# Altium schematic sheet CLOCK_Display.SchDoc
size A4; SheetNumber: 6; SheetTotal: 16
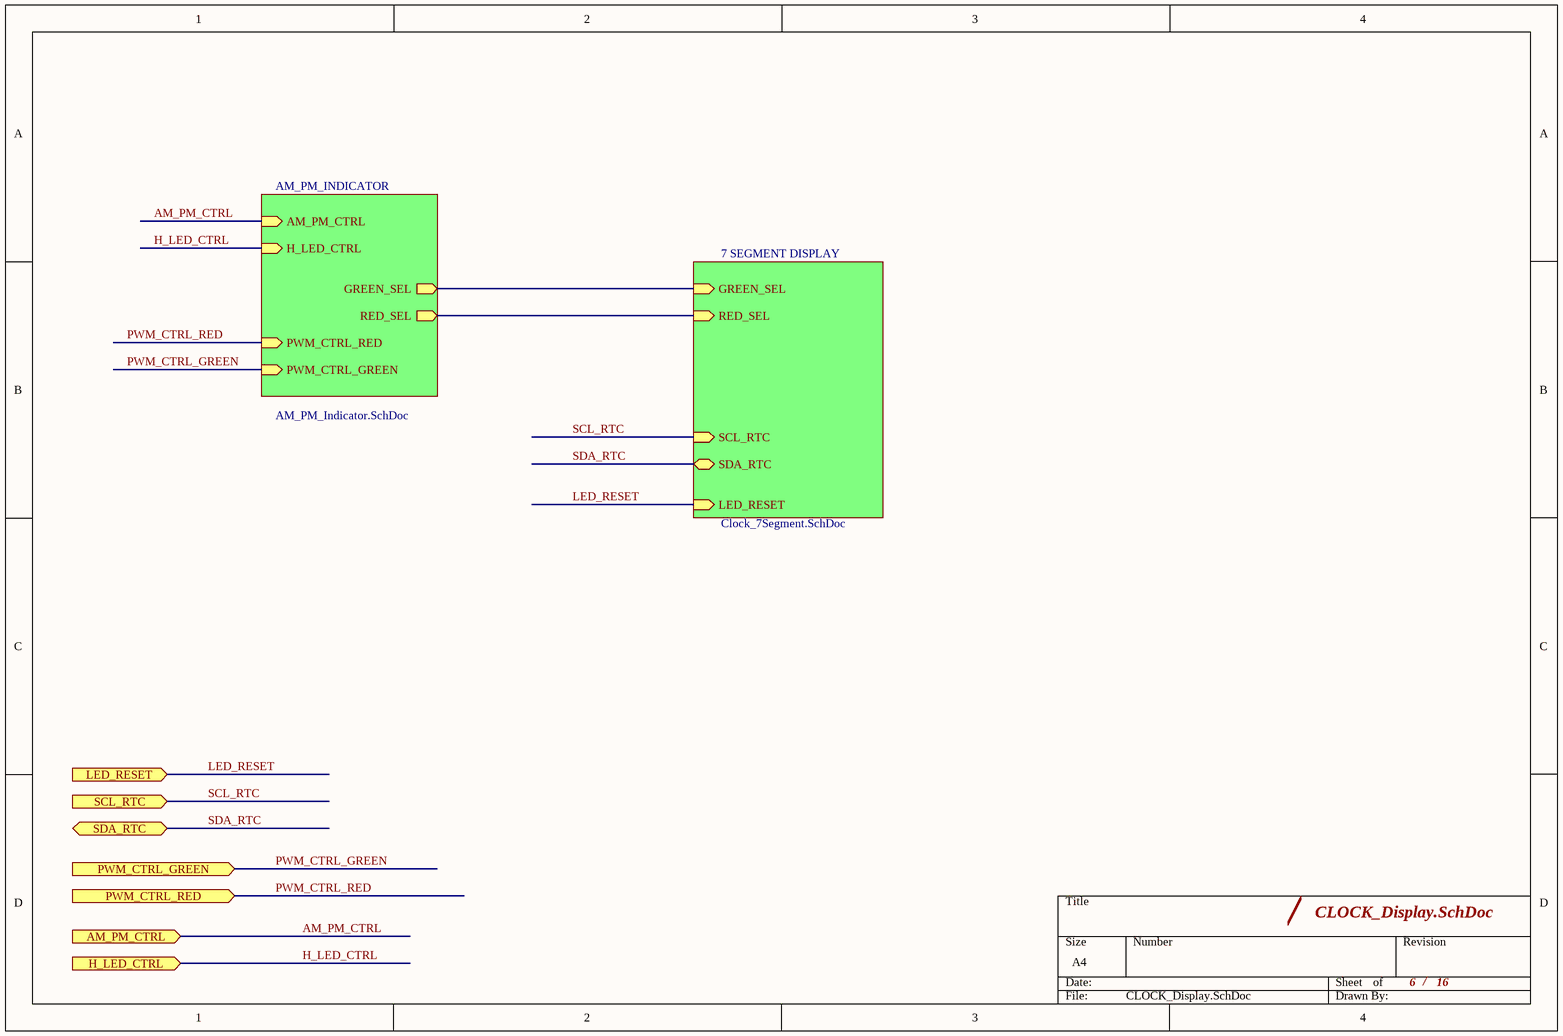
[diagram p0: CLOCK_Display.SchDoc]

## Sub-sheets
7 SEGMENT DISPLAY = Clock_7Segment.SchDoc: SCL_RTC (in), SDA_RTC (bidir), LED_RESET (in), GREEN_SEL (in), RED_SEL (in)
AM_PM_INDICATOR = AM_PM_Indicator.SchDoc: PWM_CTRL_RED (in), PWM_CTRL_GREEN (in), AM_PM_CTRL (in), H_LED_CTRL (in), RED_SEL (out), GREEN_SEL (out)

## Ports
AM_PM_CTRL (in), H_LED_CTRL (in), LED_RESET (in), PWM_CTRL_GREEN (in), PWM_CTRL_RED (in), SCL_RTC (in), SDA_RTC (bidir)

## Nets
AM_PM_CTRL: port AM_PM_CTRL, sheet AM_PM_INDICATOR/AM_PM_CTRL
H_LED_CTRL: port H_LED_CTRL, sheet AM_PM_INDICATOR/H_LED_CTRL
LED_RESET: port LED_RESET, sheet 7 SEGMENT DISPLAY/LED_RESET
PWM_CTRL_GREEN: port PWM_CTRL_GREEN, sheet AM_PM_INDICATOR/PWM_CTRL_GREEN
PWM_CTRL_RED: port PWM_CTRL_RED, sheet AM_PM_INDICATOR/PWM_CTRL_RED
SCL_RTC: port SCL_RTC, sheet 7 SEGMENT DISPLAY/SCL_RTC
SDA_RTC: port SDA_RTC, sheet 7 SEGMENT DISPLAY/SDA_RTC
(unnamed): sheet AM_PM_INDICATOR/RED_SEL, sheet 7 SEGMENT DISPLAY/RED_SEL
(unnamed): sheet AM_PM_INDICATOR/GREEN_SEL, sheet 7 SEGMENT DISPLAY/GREEN_SEL

## Notes on the sheet
- /